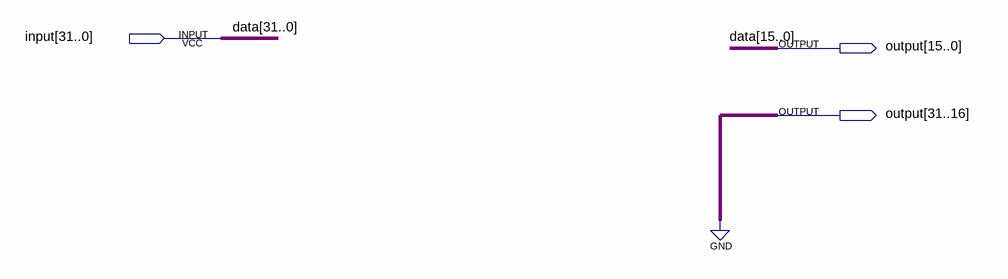
[diagram p0: schematic sheet]
// Quartus schematic ext.bdf as structural Verilog: 0 symbols, 3 pins
module ext (
  input  [31:0] \input ,
  output [31:0] \output 
);


  assign \output  = {{16{1'b0}}, \input [15:0]};

  // Other names for the same wires on the sheet: data[31:0] = \input 
endmodule
